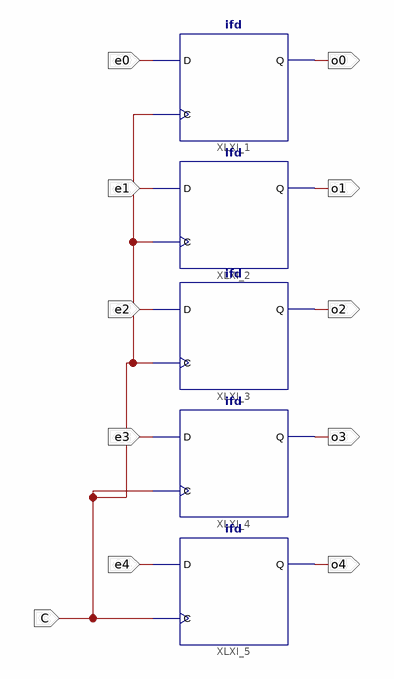
[diagram p0: schematic sheet 1]
// Xilinx ISE schematic FlipFlopD5Entrys.sch (spartan3e) as structural Verilog: 5 symbols, 11 ports
module FlipFlopD5Entrys (
  input  C,
  input  e0,
  input  e1,
  input  e2,
  input  e3,
  input  e4,
  output o0,
  output o1,
  output o2,
  output o3,
  output o4
);

  ifd XLXI_1 (.C(C), .D(e0), .Q(o0));
  ifd XLXI_2 (.C(C), .D(e1), .Q(o1));
  ifd XLXI_3 (.C(C), .D(e2), .Q(o2));
  ifd XLXI_4 (.C(C), .D(e3), .Q(o3));
  ifd XLXI_5 (.C(C), .D(e4), .Q(o4));
endmodule
